# Altium schematic sheet CAN_SHEET.SchDoc
size A4; SheetNumber: 4; SheetTotal: 10
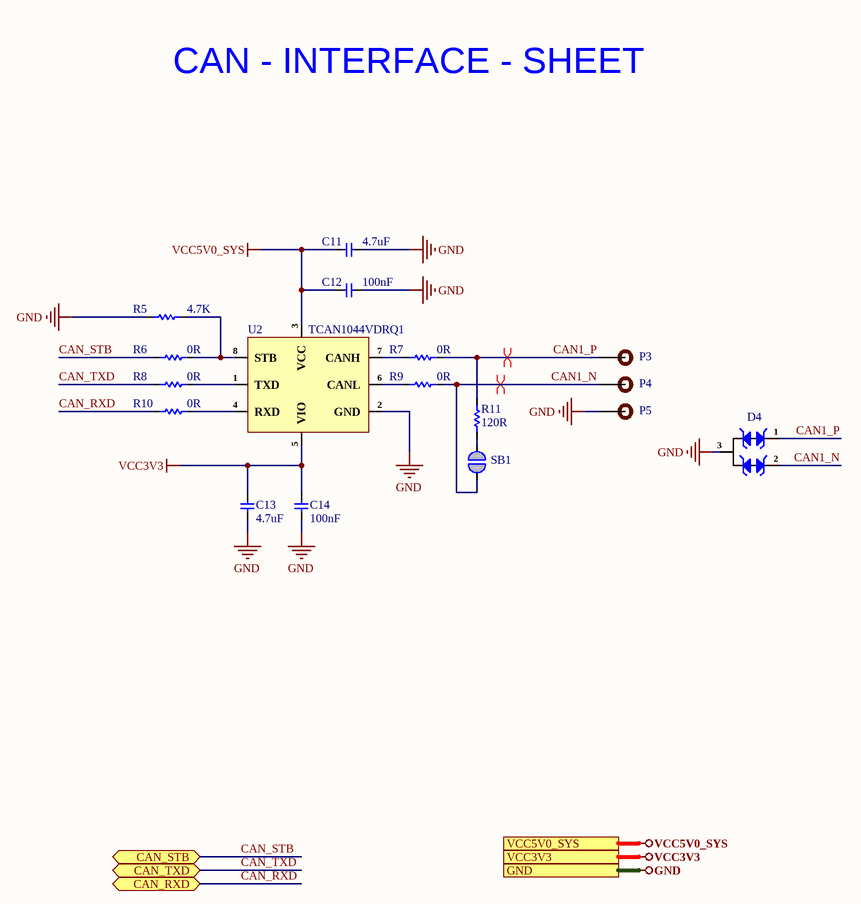
[diagram p0: CAN_SHEET.SchDoc]

## Parts
C11  4.7uF  [Cap-0402]
C12  100nF  [Cap-0402]
C13  4.7uF  [Cap-0402]
C14  100nF  [Cap-0402]
D4  CDSOT23-T24CAN-Q  [SOT-23]  (value not drawn)
P3  0.5mm Test Pad  [0.5mm Test Pad]  (value not drawn)  (no BOM)
P4  0.5mm Test Pad  [0.5mm Test Pad]  (value not drawn)  (no BOM)
P5  0.5mm Test Pad  [0.5mm Test Pad]  (value not drawn)  (no BOM)
R5  4.7K  [Res-0402]
R6  0R  [Res-0402]
R7  0R  [Res-0402]
R8  0R  [Res-0402]
R9  0R  [Res-0402]
R10  0R  [Res-0402]
R11  120R  [Res-0603]
SB1  Solder Bridge 0603  [Solder Bridge]  (value not drawn)  (no BOM)
U2  TCAN1044VDRQ1  [SOIC-8(0.154", 3.90mm Width)]

## Ports
CAN_RXD (bidir, see radxa_CM3J_SHEET-1[4C]), CAN_STB (bidir, see radxa_CM3J_SHEET-1[4C]), CAN_TXD (bidir, see radxa_CM3J_SHEET-1[4C]), GND (see GPS_INTERFACE_SHEET[3D], HDMI2.0_SHEET[3D], JOYSTICK_BUTTON_SHEET[3D], MIPI_DISPLAY-SHEET[3D], MISCELLANEOUS_SHEET[3D], POWER_SHEET[3C], radxa_CM3J_SHEET-1[4C], radxa_CM3J_SHEET-2[3D], TYPE-C_INTERFACE_SHEET[3D]), VCC3V3 (see JOYSTICK_BUTTON_SHEET[3D], radxa_CM3J_SHEET-1[4C]), VCC5V0_SYS (see HDMI2.0_SHEET[3D], MIPI_DISPLAY-SHEET[3D], POWER_SHEET[3C], radxa_CM3J_SHEET-1[4C], TYPE-C_INTERFACE_SHEET[3D])

## Nets
GND: C11.1 C12.1 C13.1 C14.1 D4.3 P5.1 R5.1 U2.2(GND) ; port GND
VCC3V3: C13.2 C14.2 U2.5(VIO) ; port VCC3V3
VCC5V0_SYS: C11.2 C12.2 U2.3(VCC) ; port VCC5V0_SYS
CAN1_N: D4.2 P4.1 R9.2 SB1.1
CAN1_P: D4.1 P3.1 R7.2 R11.2
CAN_RXD: R10.1 ; port CAN_RXD
CAN_STB: R6.1 ; port CAN_STB
CAN_TXD: R8.1 ; port CAN_TXD
NetR5_2: R5.2 R6.2 U2.8(STB)
NetR7_1: R7.1 U2.7(CANH)
NetR8_2: R8.2 U2.1(TXD)
NetR9_1: R9.1 U2.6(CANL)
NetR10_2: R10.2 U2.4(RXD)
NetR11_1: R11.1 SB1.2

## Layout directives
differential pair; differential pair class CAN: CAN1_N, CAN1_P

## Notes on the sheet
- CAN - INTERFACE - SHEET
- File:
- Title:
- Date:
- Page
- Num:
- Total:
- Drawn By: Huzaifa Ali

## Library data of the parts
C11 C13 = CC0402KRX5R6BB475: CAP CER 4.7UF 10V X5R 0402; Manufacturer: Yageo; Tolerance: 10%; Supplier 1: Farnell; Manufacturer Part Number: CC0402KRX5R6BB475; RoHS: Yes; Category: Ceramic Capacitors; Stock 1: 20000; Pricing 1: 10000=0.02310, 50000=0.02100 (GBP); Mount: Surface Mount; Case/Package: 0402; Case Code (Imperial): 0402; Case Code (Metric): 1005; Min Operating Temperature: -55°C; Max Operating Temperature: 85°C; Packaging: Cut Tape; Capacitance: 4.7uF; Voltage Rating: 10V; RoHS Compliant: Yes; ComponentLink1URL: http://www.yageo.com/documents/recent/UPY-GPHC_X5R_4V-to-50V_25.pdf?src-supplier=Digi-Key; ComponentLink1Description: http://www.yageo.com/documents/recent/UPY-GPHC_X5R_4V-to-50V_25.pdf?src-supplier=Digi-Key; Supplier Part Number 1: 3871698; LCSC Part Number: C326586
C12 C14 = CC0402KRX5R7BB104: CAP CER 0.1UF 16V X5R 0402; Manufacturer: Yageo; Tolerance: 10%; Supplier 1: Mouser; Manufacturer Part Number: CC0402KRX5R7BB104; RoHS: Yes; Category: Ceramic Capacitors; Stock 1: 936792; Pricing 1: 1=0.10000, 10=0.02300, 50=0.02300, 100=0.01100, 1000=0.00600, 10000=0.00400 (USD); Mount: Surface Mount; Case/Package: 0402; Number of Pins: 2; Case Code (Metric): 1005; Case Code (Imperial): 0402; Min Operating Temperature: -55°C; Max Operating Temperature: 85°C; Capacitance: 100nF; Dielectric: X5R; Packaging: Tape and Reel; Voltage Rating: 16V; Package Quantity: 1; Voltage Rating (DC): 16V; Termination: SMD/SMT; Resistor Type: Ceramic; Series: CC; Construction: Flat; Length: 1mm; Width: 0.02inch; Height: 0.5mm; Thickness: 0.022inch; Depth: 0.5mm; Radiation Hardening: No; REACH SVHC: Unknown; Lead Free: Lead Free; Halogen Free: Halogen Free; RoHS Compliant: Yes; ComponentLink1URL: https://datasheet.ciiva.com/155/mlccorderingcode-155879.pdf?src-supplier=Digi-Key; ComponentLink1Description: https://datasheet.ciiva.com/155/mlccorderingcode-155879.pdf?src-supplier=Digi-Key; ComponentLink2URL: https://datasheet.ciiva.com/155/mlccorderingcode-155878.pdf?src-supplier=Digi-Key; ComponentLink2Description: https://datasheet.ciiva.com/155/mlccorderingcode-155878.pdf?src-supplier=Digi-Key; ComponentLink3URL: https://datasheet.ciiva.com/155/mlccorderingcode-155880.pdf?src-supplier=Digi-Key; ComponentLink3Description: https://datasheet.ciiva.com/155/mlccorderingcode-155880.pdf?src-supplier=Digi-Key; ComponentLink4URL: https://datasheet.ciiva.com/11464/upy-gphc-x5r-4v-to-50v-12-11464869.pdf?src-supplier=Avnet; ComponentLink4Description: https://datasheet.ciiva.com/11464/upy-gphc-x5r-4v-to-50v-12-11464869.pdf?src-supplier=Avnet; Supplier Part Number 1: 603-CC402KRX5R7BB104; LCSC Part Number: C106204
D4 = CDSOT23-T24CAN-Q: TVS DIODE 24VWM 40VC SOT23-3; Manufacturer: Bourns; Item Type: TVS Diodes; Supplier: Digikey; LCSC Part Number: C350941; Manufacturer Part Number: CDSOT23-T24CAN-Q; RoHS: Yes; Stock: 17231; Pricing: 1=0.36, 10=0.282, 100=0.1691, 500=0.15656, 1000=0.10645, 3000=0.098, 6000=0.09393, 9000=0.08454, 30000=0.08328, 75000=0.07827 (USD); RoHS Compliant: 5897YesNo; ComponentLink1URL: http://www.farnell.com/datasheets/2372435.pdf?src-supplier=Farnell; ComponentLink1Description: http://www.farnell.com/datasheets/2372435.pdf?src-supplier=Farnell; ComponentLink2URL: https://www.bourns.com/docs/Product-Datasheets/cdsot23-t24can-Q.pdf?src-supplier=Digikey; ComponentLink2Description: https://www.bourns.com/docs/Product-Datasheets/cdsot23-t24can-Q.pdf?src-supplier=Digikey; ComponentLink3URL: http://www.farnell.com/datasheets/2372435.pdf?src-supplier=Newark; ComponentLink3Description: http://www.farnell.com/datasheets/2372435.pdf?src-supplier=Newark
P3-P5 = 0.5mm Test Pad: Test pad
R5 = RC0402FR-074K7L: RES 4.7K OHM 1% 1/16W 0402; Manufacturer: Yageo; Voltage Rating (DC): 50V; Power Rating: 62.5mW; Resistance: 4.7kR; Temperature Coefficient: 100ppm/°C; Max Power Dissipation: 63mW; Item Type: Resistor; Supplier 1: Avnet; Manufacturer Part Number: RC0402FR-074K7L; RoHS: Yes; Category: Chip SMD Resistors; Stock 1: 2420000; Pricing 1: 10000=0.00085 (USD); Case/Package: 0402; Number of Pins: 2; Case Code (Imperial): 0402; Case Code (Metric): 1005; Size Code: 0402; Min Operating Temperature: -55°C; Max Operating Temperature: 155°C; Tolerance: 1%; Voltage Rating: 50V; Packaging: Tape and Reel; Resistor Type: Thick Film; Termination: SMD/SMT; Features: Moisture Resistant; Series: RC; Number of Terminations: 2; Resistance Tolerance: 1%; Construction: Rectangular; Length: 1mm; Width: 0.5mm; Height: 0.32mm; Depth: 0.5mm; Height - Seated (Max): 0.016inch; RoHS Compliant: Yes; Reach SVHC Compliant: Yes; Military Standard: Not; Lead Free: Lead Free; ComponentLink1URL: https://datasheet.ciiva.com/22661/1686128-22661342.pdf?src-supplier=Element14; ComponentLink1Description: https://datasheet.ciiva.com/22661/1686128-22661342.pdf?src-supplier=Element14; ComponentLink2URL: https://datasheet.ciiva.com/7850/1018594-7850022.pdf?src-supplier=Element14; ComponentLink2Description: https://datasheet.ciiva.com/7850/1018594-7850022.pdf?src-supplier=Element14; ComponentLink3URL: https://datasheet.ciiva.com/7850/1018594-7850023.pdf?src-supplier=Element14; ComponentLink3Description: https://datasheet.ciiva.com/7850/1018594-7850023.pdf?src-supplier=Element14; ComponentLink4URL: https://datasheet.ciiva.com/15215/getdatasheetpartid-328119-15215035.pdf?src-supplier=Verical; ComponentLink4Description: https://datasheet.ciiva.com/15215/getdatasheetpartid-328119-15215035.pdf?src-supplier=Verical; Supplier Part Number 1: RC0402FR-074K7L; LCSC Part Number: C105871
R6-R10 = RC0402FR-070RL: RES 0 OHM JUMPER 1/16W 0402; Manufacturer: Yageo; Item Type: Resistors; Tolerance: 1%; Power Rating: 62.5mW; Voltage Rating: 50V; Temperature Coefficient: 200ppm/°C; Max Power Dissipation: 63mW; Supplier 1: Mouser; Manufacturer Part Number: RC0402FR-070RL; RoHS: Yes; Stock 1: 8556842; Pricing 1: 1=0.10000, 10=0.01400, 50=0.01400, 100=0.00600, 1000=0.00300, 5000=0.00200, 10000=0.00100 (USD); Mount: Surface Mount; Case/Package: 0402; Contact Plating: Tin,Matte; Case Code (Imperial): 0402; Case Code (Metric): 1005; Size Code: 0402; Min Operating Temperature: -55°C; Max Operating Temperature: 155°C; Resistance: 0R; Resistor Type: Thick Film; Packaging: Tape and Reel; Termination: SMD/SMT; Features: Moisture Resistant; Series: RC; Number of Terminations: 2; Length: 1mm; Width: 0.5mm; Height: 0.35mm; Radiation Hardening: No; Lead Free: Lead Free; RoHS Compliant: Yes; ComponentLink1URL: https://datasheet.ciiva.com/8896/pyu-rc0402-51-rohs-l-6-8896149.pdf?src-supplier=Avnet; ComponentLink1Description: https://datasheet.ciiva.com/8896/pyu-rc0402-51-rohs-l-6-8896149.pdf?src-supplier=Avnet; ComponentLink2URL: https://datasheet.ciiva.com/16790/pyu-rc0402-51-rohs-l-6-r-16790444.pdf?src-supplier=Future+Electronics; ComponentLink2Description: https://datasheet.ciiva.com/16790/pyu-rc0402-51-rohs-l-6-r-16790444.pdf?src-supplier=Future+Electronics; Supplier Part Number 1: 603-RC0402FR-070RL; LCSC Part Number: C106231
R11 = RC0603FR-07120RL: RES 120 OHM 1% 1/10W 0603; Manufacturer: Yageo; Temperature Coefficient: 100ppm/°C; Voltage Rating (DC): 50V; Power Rating: 100mW; Item Type: Resistor; Supplier 1: Digi-Key; Manufacturer Part Number: RC0603FR-07120RL; RoHS: Yes; Category: Chip SMD Resistors; Stock 1: 839061; Pricing 1: 1=0.10000, 10=0.02400, 100=0.00970, 1000=0.00436, 2500=0.00378 (USD); Case/Package: 0603; Number of Pins: 2; Case Code (Metric): 1608; Case Code (Imperial): 0603; Size Code: 0603; Min Operating Temperature: -55°C; Max Operating Temperature: 155°C; Resistance: 120R; Tolerance: 1%; Resistor Type: Thick Film; Packaging: Tape and Reel; Voltage Rating: 50V; Package Quantity: 1; Number of Terminations: 2; Termination: SMD/SMT; Max Power Dissipation: 100mW; Features: Moisture Resistant; Series: RC; Construction: Rectangular; Resistance Tolerance: 1%; Length: 1.6mm; Width: 0.031inch; Height: 0.022inch; Depth: 0.8mm; REACH SVHC: No SVHC; Lead Free: Lead Free; Military Standard: Not; RoHS Compliant: Yes; ComponentLink1URL: https://datasheet.ciiva.com/2553/pyu-r-int-thick-7-2553512.pdf?src-supplier=Digi-Key; ComponentLink1Description: https://datasheet.ciiva.com/2553/pyu-r-int-thick-7-2553512.pdf?src-supplier=Digi-Key; ComponentLink2URL: https://datasheet.ciiva.com/7746/443971-7746248.pdf?src-supplier=Element14; ComponentLink2Description: https://datasheet.ciiva.com/7746/443971-7746248.pdf?src-supplier=Element14; ComponentLink3URL: https://datasheet.ciiva.com/2553/pyu-r-int-thick-7-2553513.pdf?src-supplier=Digi-Key; ComponentLink3Description: https://datasheet.ciiva.com/2553/pyu-r-int-thick-7-2553513.pdf?src-supplier=Digi-Key; ComponentLink4URL: https://datasheet.ciiva.com/7746/443971-7746249.pdf?src-supplier=Element14; ComponentLink4Description: https://datasheet.ciiva.com/7746/443971-7746249.pdf?src-supplier=Element14; ComponentLink5URL: https://datasheet.ciiva.com/2553/pyu-r-int-thick-7-2553514.pdf?src-supplier=Digi-Key; ComponentLink5Description: https://datasheet.ciiva.com/2553/pyu-r-int-thick-7-2553514.pdf?src-supplier=Digi-Key; ComponentLink6URL: https://datasheet.ciiva.com/46395/443971-46395021.pdf?src-supplier=Element14; ComponentLink6Description: https://datasheet.ciiva.com/46395/443971-46395021.pdf?src-supplier=Element14; Supplier Part Number 1: 311-120HRCT-ND; LCSC Part Number: C114640
SB1 = Solder Bridge 0603: Solder Bridge ON; Manufacturer Part Number: Solder Bridge; Item Type: Solder Bridge
U2 = TCAN1044VDRQ1: IC TRANSCEIVER 1/1 8SOIC; Manufacturer: Texas Instruments; Supplier: Mouser; Supplier Part Number: 595-TCAN1044VDRQ1; Manufacturer Part Number: TCAN1044VDRQ1; RoHS: Yes; Category: Interface ICs; Stock: 317; Pricing: 1=1.4, 10=1.19, 50=1.19, 100=0.912, 1000=0.636, 10000=0.554 (USD); ComponentLink1URL: http://www.ti.com/general/docs/suppproductinfo.tsp?distId=10&amp;gotoUrl=http%3A%2F%2Fwww.ti.com%2Flit%2Fgpn%2Ftcan1044-q1&src-supplier=Digikey; ComponentLink1Description: http://www.ti.com/general/docs/suppproductinfo.tsp?distId=10&amp;gotoUrl=http%3A%2F%2Fwww.ti.com%2Flit%2Fgpn%2Ftcan1044-q1&src-supplier=Digikey; LCSC Part Number: C1852061; Item Type: IC